# Altium schematic sheet schematic.SchDoc
size A4
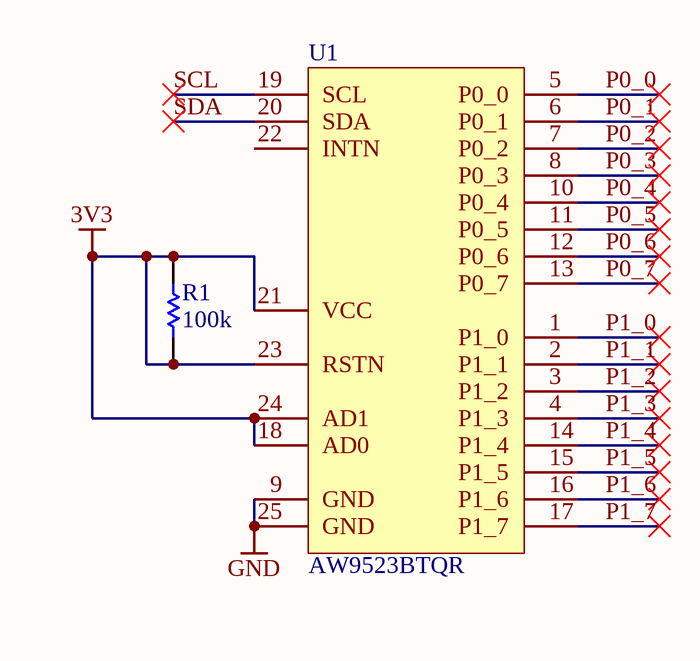
[diagram p0: schematic.SchDoc]

## Parts
R1  100k  [R0402]
U1  AW9523BTQR  [VFQFPN-24_L4.0-W4.0-P0.50-BL-EP2.8]

## Nets
3V3: R1.1 R1.2 U1.18(AD0) U1.21(VCC) U1.23(RSTN) U1.24(AD1)
GND: U1.9(GND) U1.25(GND)
P0_0: U1.5(P0_0)
P0_1: U1.6(P0_1)
P0_2: U1.7(P0_2)
P0_3: U1.8(P0_3)
P0_4: U1.10(P0_4)
P0_5: U1.11(P0_5)
P0_6: U1.12(P0_6)
P0_7: U1.13(P0_7)
P1_0: U1.1(P1_0)
P1_1: U1.2(P1_1)
P1_2: U1.3(P1_2)
P1_3: U1.4(P1_3)
P1_4: U1.14(P1_4)
P1_5: U1.15(P1_5)
P1_6: U1.16(P1_6)
P1_7: U1.17(P1_7)
SCL: U1.19(SCL)
SDA: U1.20(SDA)

Not connected (* = marked no-connect by the designer): U1 22(INTN)

## Library data of the parts
R1 = Resistor_100k_5%: 100k 0402; P/N: RC0402FR-07100KL; LCSC part number: C60491
U1 = AW9523BTQR: Manufacturer: AWINIC(艾为); Add into BOM: yes; Interface: I2C; Number of I/O: 16; Output Type: Push-Pull；Open-drain; Current - Output Low(IOL): 20mA; Clock Frequency: 400kHz; Number of Supporting Devices: 4; Quiescent Supply Current: 100nA; Output Logic Level - Low: 60mV; Voltage - Supply: 2.4V~5.5V; Symbol: AW9523BTQR; Device: AW9523BTQR; LCSC Part Name: AW9523B产品手册; Supplier Part: C148077; Manufacturer Part: AW9523BTQR; Supplier Footprint: TQFN-24-EP(4x4); JLCPCB Part Class: Extended Part; Datasheet: https://item.szlcsc.com/datasheet/AW9523BTQR/159410.html; Supplier: LCSC; Convert to PCB: yes; Interrupt Output: Interrupt Output; Current - Output High(IOH): -; Features: Built-in LED driver；Reset function；Cascade and address expansion；IO level configurable；Input anti-jitter; Operating Temperature: -40℃~+85℃